# Altium schematic sheet Level Shifters.SchDoc: Level Shifters
size A4; DrawnBy: AT; SheetNumber: 2; SheetTotal: 5
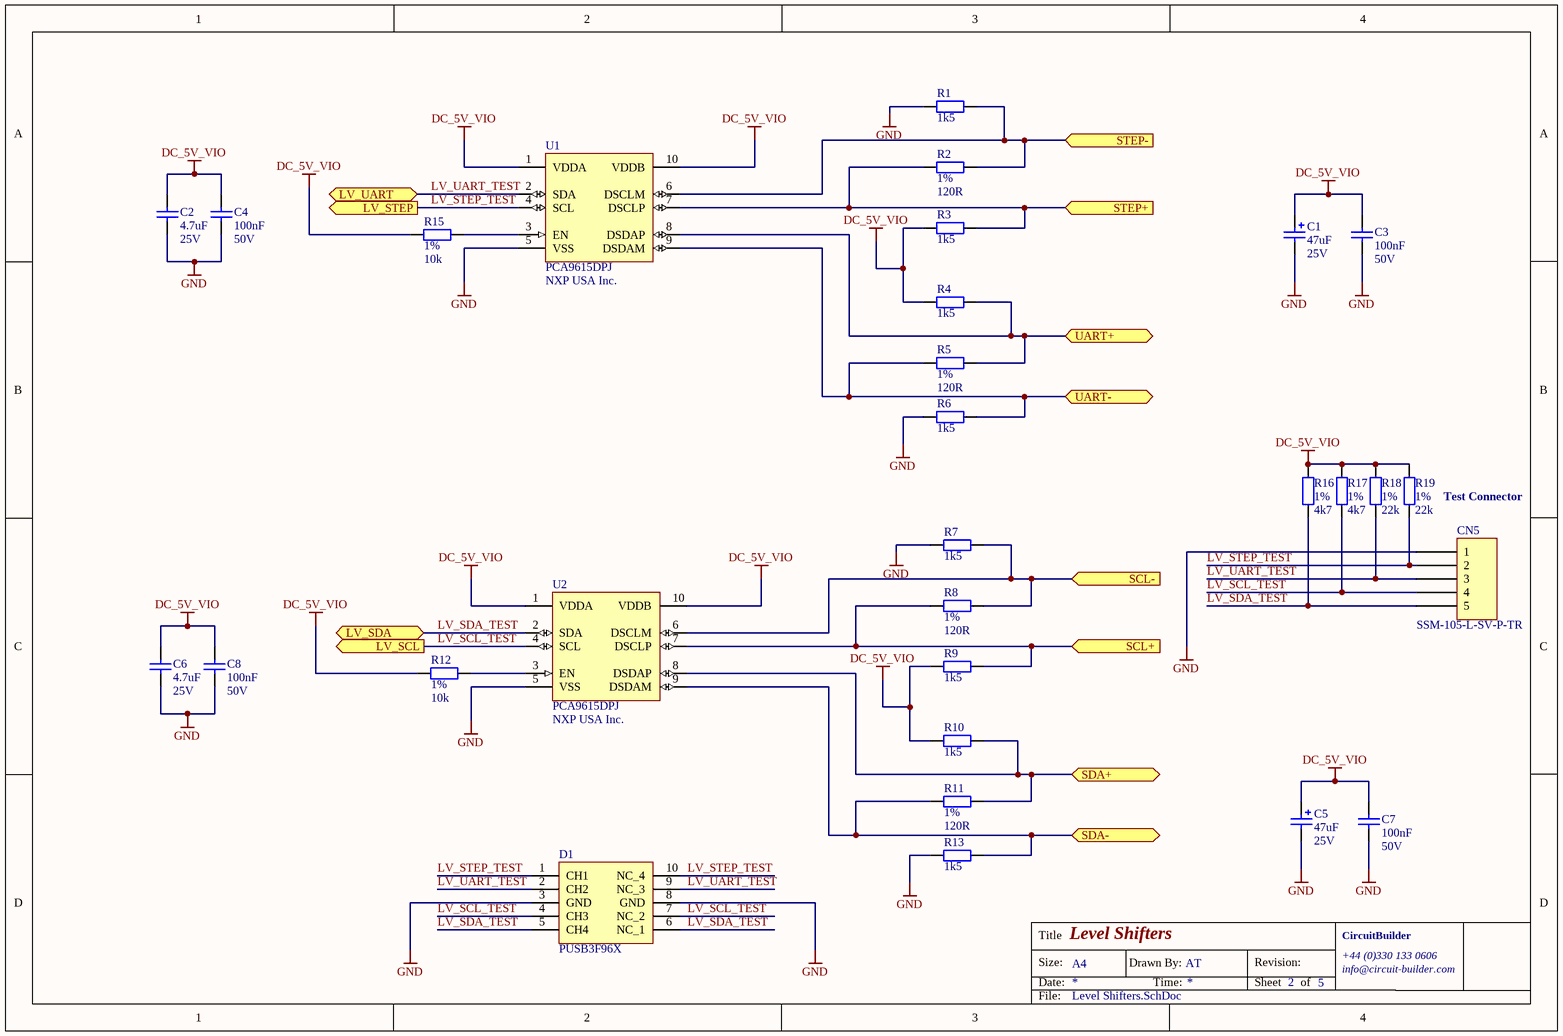
[diagram p0: Level Shifters.SchDoc]

## Parts
C1  value 47uF  Voltage: 25V  [RADIAl-CAN-6.3MM-DIA]  (hidden comment: 47uF 25V Aluminium SMD Capacitor, 20%)
C2  value 4.7uF  Voltage: 25V  [C0603]  (hidden comment: 4.7uF 0603 Ceramic Capacitor, 10%, 25V)
C3  value 100nF  Voltage: 50V  [C0603]  (hidden comment: 100nF 0603 Ceramic Capacitor, 10%, X7R, 50V)
C4  value 100nF  Voltage: 50V  [C0603]  (hidden comment: 100nF 0603 Ceramic Capacitor, 10%, X7R, 50V)
C5  value 47uF  Voltage: 25V  [RADIAl-CAN-6.3MM-DIA]  (hidden comment: 47uF 25V Aluminium SMD Capacitor, 20%)
C6  value 4.7uF  Voltage: 25V  [C0603]  (hidden comment: 4.7uF 0603 Ceramic Capacitor, 10%, 25V)
C7  value 100nF  Voltage: 50V  [C0603]  (hidden comment: 100nF 0603 Ceramic Capacitor, 10%, X7R, 50V)
C8  value 100nF  Voltage: 50V  [C0603]  (hidden comment: 100nF 0603 Ceramic Capacitor, 10%, X7R, 50V)
CN5  1x5 Way 2.54mm Pitch SMT Socket  [SSM-105-L-SV-P-TR]  (value not drawn)
D1  ManufacturerPN: PUSB3F96X  [DFN2510A-10]  (hidden comment: TVS DIODE 5.5V 4.6V 10DFN2510)
R1  value 1k5  [R0603]  (hidden comment: 1k5 0603 Chip Resistor, 5%, 0.1W)
R2  value 120R  Tolerance: 1%  [R0603]  (hidden comment: 120R 0603 Chip Resistor, 1%, 0.1W)
R3  value 1k5  [R0603]  (hidden comment: 1k5 0603 Chip Resistor, 5%, 0.1W)
R4  value 1k5  [R0603]  (hidden comment: 1k5 0603 Chip Resistor, 5%, 0.1W)
R5  value 120R  Tolerance: 1%  [R0603]  (hidden comment: 120R 0603 Chip Resistor, 1%, 0.1W)
R6  value 1k5  [R0603]  (hidden comment: 1k5 0603 Chip Resistor, 5%, 0.1W)
R7  value 1k5  [R0603]  (hidden comment: 1k5 0603 Chip Resistor, 5%, 0.1W)
R8  value 120R  Tolerance: 1%  [R0603]  (hidden comment: 120R 0603 Chip Resistor, 1%, 0.1W)
R9  value 1k5  [R0603]  (hidden comment: 1k5 0603 Chip Resistor, 5%, 0.1W)
R10  value 1k5  [R0603]  (hidden comment: 1k5 0603 Chip Resistor, 5%, 0.1W)
R11  value 120R  Tolerance: 1%  [R0603]  (hidden comment: 120R 0603 Chip Resistor, 1%, 0.1W)
R12  value 10k  Tolerance: 1%  [R0603]  (hidden comment: 10k 0603 Chip Resistor, 1%, 0.1W)
R13  value 1k5  [R0603]  (hidden comment: 1k5 0603 Chip Resistor, 5%, 0.1W)
R15  value 10k  Tolerance: 1%  [R0603]  (hidden comment: 10k 0603 Chip Resistor, 1%, 0.1W)
R16  value 4k7  Tolerance: 1%  [R0603]  (hidden comment: 4k7 0603 Chip Resistor, 1%, 0.1W)
R17  value 4k7  Tolerance: 1%  [R0603]  (hidden comment: 4k7 0603 Chip Resistor, 1%, 0.1W)
R18  value 22k  Tolerance: 1%  [R0603]  (hidden comment: 22k 0603 Chip Resistor, 1%, 0.1W)
R19  value 22k  Tolerance: 1%  [R0603]  (hidden comment: 22k 0603 Chip Resistor, 1%, 0.1W)
U1  PCA9615DPJ  Manufacturer: NXP USA Inc.  [TSSOP50P490X110-10N]
U2  PCA9615DPJ  Manufacturer: NXP USA Inc.  [TSSOP50P490X110-10N]

## Ports
LV_SCL (out), LV_SDA (bidir), LV_STEP (out), LV_UART (bidir), SCL+ (in), SCL- (in), SDA+ (bidir), SDA- (bidir), STEP+ (in), STEP- (in), UART+ (bidir), UART- (bidir)

## Nets
DC_5V_VIO: C1.+ C2.2 C3.2 C4.2 C5.+ C6.2 C7.2 C8.2 R3.2 R4.2 R9.2 R10.2 R12.1 R15.1 R16.2 R17.2 R18.2 R19.2 U1.1(VDDA) U1.10(VDDB) U2.1(VDDA) U2.10(VDDB)
GND: C1.- C2.1 C3.1 C4.1 C5.- C6.1 C7.1 C8.1 CN5.1 D1.3(GND) D1.8(GND) R1.2 R6.2 R7.2 R13.2 U1.5(VSS) U2.5(VSS)
LV_SCL_TEST: CN5.4 D1.4(CH3) D1.7(NC_2) R17.1 U2.4(SCL) ; port LV_SCL
LV_SDA_TEST: CN5.5 D1.5(CH4) D1.6(NC_1) R16.1 U2.2(SDA) ; port LV_SDA
LV_STEP_TEST: CN5.2 D1.1(CH1) D1.10(NC_4) R19.1 U1.4(SCL) ; port LV_STEP
LV_UART_TEST: CN5.3 D1.2(CH2) D1.9(NC_3) R18.1 U1.2(SDA) ; port LV_UART
SCL+: R8.2 R9.1 U2.7(DSCLP) ; port SCL+
SCL-: R7.1 R8.1 U2.6(DSCLM) ; port SCL-
SDA+: R10.1 R11.1 U2.8(DSDAP) ; port SDA+
SDA-: R11.2 R13.1 U2.9(DSDAM) ; port SDA-
STEP+: R2.2 R3.1 U1.7(DSCLP) ; port STEP+
STEP-: R1.1 R2.1 U1.6(DSCLM) ; port STEP-
UART+: R4.1 R5.1 U1.8(DSDAP) ; port UART+
UART-: R5.2 R6.1 U1.9(DSDAM) ; port UART-
NetR12_2: R12.2 U2.3(EN)
NetR15_2: R15.2 U1.3(EN)

## Notes on the sheet
- Test Connector
- Title
- Size:
- Date:
- A4
- Drawn By:
- Time:
- Revision:
- Sheet
- of
- CircuitBuilder
- +44 (0)330 133 0606
- info@circuit-builder.com
- File:

## Library data of the parts
C1 C5 = 47uF 25V Aluminium SMD Capacitor, 20%: Manufacturer: Panasonic Electronic Components; ManufacturerPN: 25SVPF47M; Cost-10000: 0.3; Supplier1: Digikey; Supplier1PN: P16513TR-ND; Supplier2: Open Market; Cost: 1.06; Tolerance: 20%; Supplier1PNProto: P16513CT-ND
C2 C6 = 4.7uF 0603 Ceramic Capacitor, 10%, 25V_1: Manufacturer: Samsung Electro-Mechanics America, Inc; ManufacturerPN: CL10A475KA8NQNC; Flex Part Number: ROL-F120-0783; Cost-10000: 0.04744; Supplier1: Digikey; Supplier1PN: 1276-1900-2-ND; Cost: 0.22; Package: 0603; Tolerance: 10%; Supplier2: Open Market; Supplier1PNProto: 1276-1900-1-ND
C3 C4 C7 C8 = 100nF 0603 Ceramic Capacitor, 10%, X7R, 50V: Manufacturer: AVX; ManufacturerPN: 06035C104KAZ2A; Cost-10000: 0.0192; Supplier1: Farnell; Supplier1PN: 1301894; Cost: 0.0671; Package: 0603; Tolerance: 10%; Supplier2: Open Market; Supplier1PNProto: 1301894
CN5 = 1x5 Way 2.54mm Pitch SMT Socket: 5 Position Receptacle Connector 0.1" (2.54mm) Surface Mount Gold; Manufacturer: Samtec Inc; Cost-10000: 1.16; ManufacturerPN: SSM-105-L-SV-P-TR; Supplier1: Digikey; Supplier1PN: SAM14594TR-ND; Cost: 1.83; Supplier1PNProto: SAM14594CT-ND; Created by: *
D1 = TVS DIODE 5.5V 4.6V 10DFN2510: 4.6V (Typ) Clamp 5.2A (8/20µs) Ipp Tvs Diode Surface Mount DFN2510A-10; Manufacturer: Nexperia USA Inc.; Cost-10000: 0.10268; Supplier1: Digikey; Supplier1PN: 1727-2030-2-ND; Cost: 0.39; Package: DFN2510A-10; Supplier1PNProto: 1727-2030-1-ND
R1 R3 R4 R6 R7 R9 R10 R13 = 1k5 0603 Chip Resistor, 5%, 0.1W: Manufacturer: Samsung Electro-Mechanics America, Inc; ManufacturerPN: RC1608J152CS; Flex Part Number: RES0016; Cost-10000: 0.00077; Supplier1: Digikey; Supplier1PN: 1276-5066-2-ND; Cost: 0.00089; Supplier2: Open Market; Supplier1PNProto: 1276-5066-1-ND; Tolerance: 5%
R2 R5 R8 R11 = 120R 0603 Chip Resistor, 1%, 0.1W: Manufacturer: Panasonic Electronic Components; ManufacturerPN: ERJ-3EKF1200V; Cost-10000: 0.00771; Supplier1: Digikey; Supplier1PN: P120HCT-ND; Cost: 0.08; Supplier2: Open Market; Supplier1PNProto: P120HCT-ND
R12 R15 = 10k 0603 Chip Resistor, 1%, 0.1W: Manufacturer: Samsung Electro-Mechanics America, Inc; ManufacturerPN: RC1608F103CS; Cost-10000: 0.00095; ProductionCost: 0.0012; Supplier1: Digikey; Supplier1PN: 1276-3485-2-ND; Cost: 0.07; Supplier2: Open Market; Supplier1PNProto: 1276-3485-1-ND; ProductionSupplier: LCSC; ProductionSupplierPN: C115324
R16 R17 = 4k7 0603 Chip Resistor, 1%, 0.1W: Manufacturer: Samsung Electro-Mechanics America, Inc; ManufacturerPN: RC1608F472CS; Flex Part Number: ROL-F130-1087; Cost-10000: 0.00099; Supplier1: Digikey; Supplier1PN: 1276-3502-2-ND; Cost: 0.07; Supplier2: Open Market; Supplier1PNProto: 1276-3502-1-ND
R18 R19 = 22k 0603 Chip Resistor, 1%, 0.1W: Manufacturer: Samsung Electro-Mechanics America, Inc; ManufacturerPN: RC1608F223CS; Cost-10000: 0.08; Supplier1: Digikey; Supplier1PN: 1276-4772-2-ND; Cost: 0.00089; Supplier2: Open Market; Supplier1PNProto: 1276-4772-1-ND
U1 U2 = PCA9615DPJ: Buffer, ReDriver 2 Channel 400kHz 10-TSSOP; ManufacturerPN: PCA9615DPJ; Supplier1: Digikey; Supplier1PN: 568-11484-1-ND; Supplier1PNProto: 568-11484-1-ND; Supplier2: Farnell; Supplier2PN: 2775967